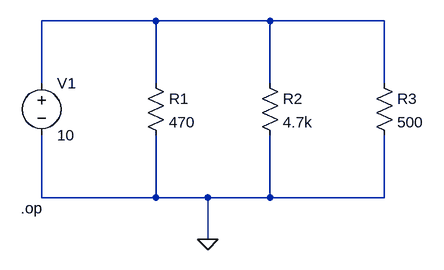
[diagram p0: schematic CDR.asc]
CDR.asc, the LTspice schematic file:
Version 4.1
SHEET 1 880 680
WIRE 208 48 32 48
WIRE 384 48 208 48
WIRE 560 48 384 48
WIRE 32 144 32 48
WIRE 208 144 208 48
WIRE 384 144 384 48
WIRE 560 144 560 48
WIRE 32 320 32 224
WIRE 208 320 208 224
WIRE 208 320 32 320
WIRE 288 320 208 320
WIRE 384 320 384 224
WIRE 384 320 288 320
WIRE 560 320 560 224
WIRE 560 320 384 320
WIRE 288 384 288 320
FLAG 288 384 0
SYMBOL voltage 32 128 R0
WINDOW 123 0 0 Left 0
WINDOW 39 0 0 Left 0
SYMATTR InstName V1
SYMATTR Value 10
SYMBOL res 192 128 R0
SYMATTR InstName R1
SYMATTR Value 470
SYMBOL res 368 128 R0
SYMATTR InstName R2
SYMATTR Value 4.7k
SYMBOL res 544 128 R0
SYMATTR InstName R3
SYMATTR Value 500
TEXT 0 336 Left 2 !.op

The netlist it stands for:
* CDR.asc
V1 N001 0 10
R1 N001 0 470
R2 N001 0 4.7k
R3 N001 0 500
.op
.backanno
.end